# Altium project piec_aero.PrjPcb
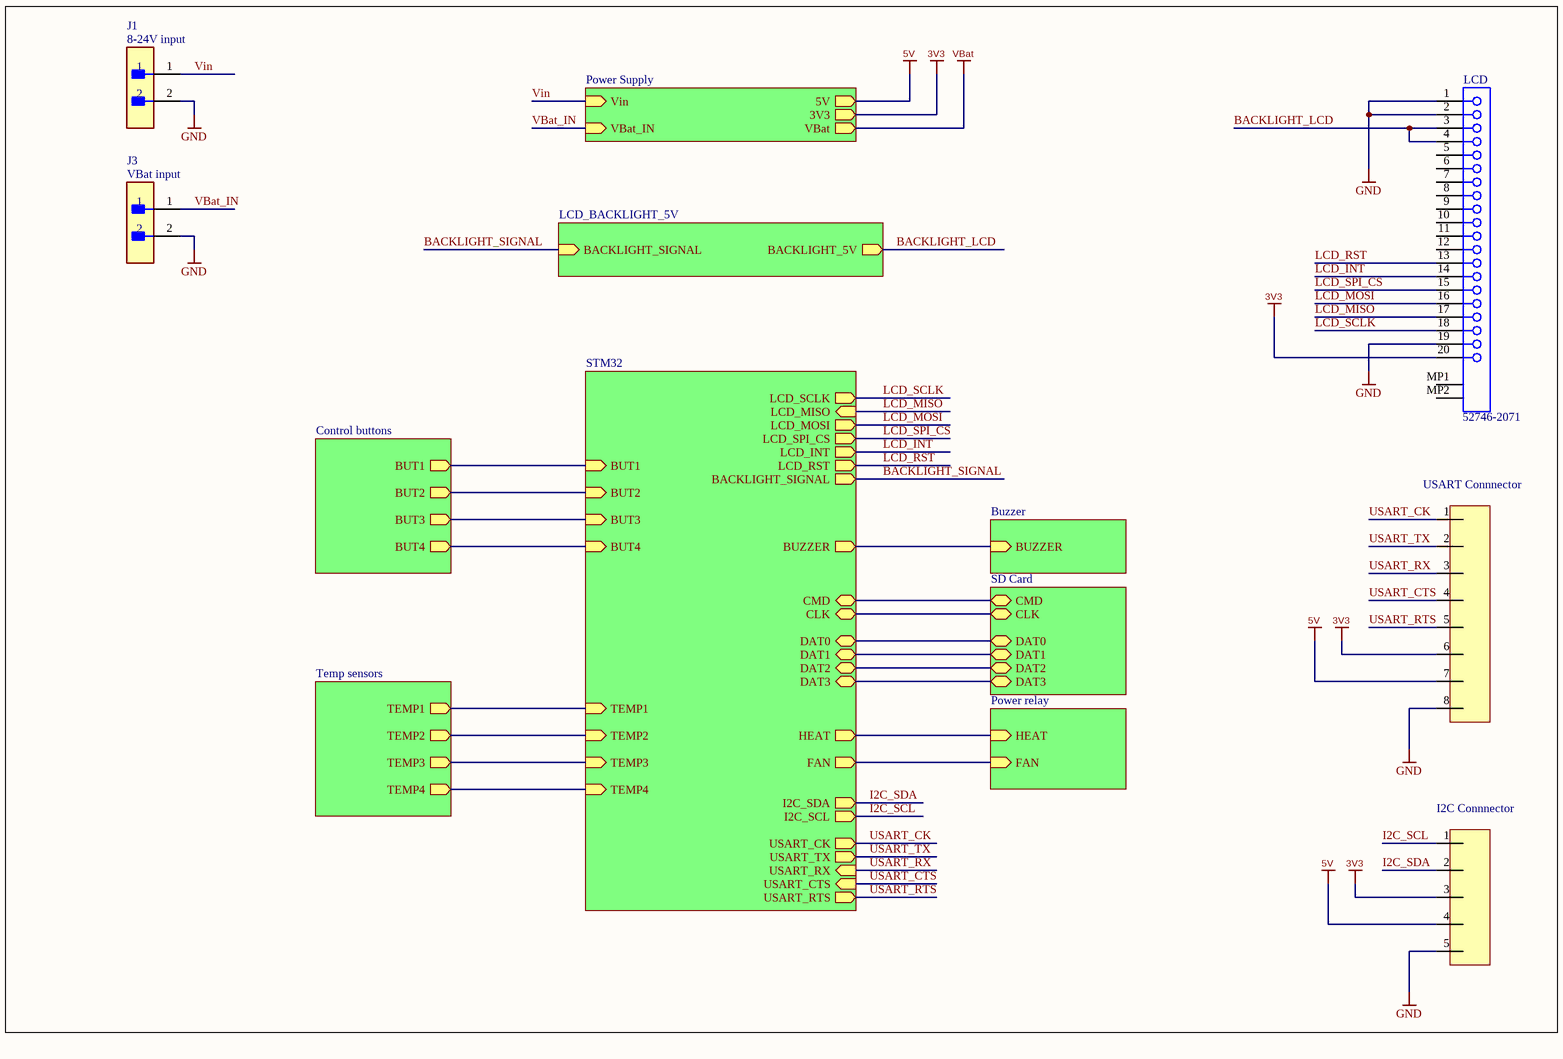
[diagram p0: MAIN_SCHEMATIC.SchDoc]
9 sheets, 164 parts. Net scope: hierarchical (ports join the sheet entries above them; power ports are global).
Board file: FURNACE.PcbDoc
Sheets:
  MAIN_SCHEMATIC.SchDoc
    STM32 = STM32.SchDoc
    Power Supply = POWER_SUPPLY.SchDoc
    Control buttons = BUTTONS.SchDoc
    Temp sensors = PT1000.SchDoc
    Power relay = SR40A.SchDoc
    SD Card = SD_CARD.SchDoc
    Buzzer = BUZZER.SchDoc
    LCD_BACKLIGHT_5V = 3V3_5V_LEVEL_SHIFTER.SchDoc

## Sheet MAIN_SCHEMATIC.SchDoc
size A4; SheetNumber: 1; SheetTotal: 9

### Parts
J1  B2B-XH-A(LF)(SN)  [FP-B2B-XH-A_LF_SN-MFG]  (value not drawn)
J2  52746-2071  [MOLX-52746-2071]
J3  B2B-XH-A(LF)(SN)  [FP-B2B-XH-A_LF_SN-MFG]  (value not drawn)
J4  NSL254M-8G  [NSL254M-8G]  (value not drawn)
J5  NSL254M-5G  [NSL254M-5G]  (value not drawn)

### Sub-sheets
Buzzer = BUZZER.SchDoc: BUZZER (in)
Control buttons = BUTTONS.SchDoc: BUT1 (out), BUT2 (out), BUT3 (out), BUT4 (out)
LCD_BACKLIGHT_5V = 3V3_5V_LEVEL_SHIFTER.SchDoc: BACKLIGHT_SIGNAL (in), BACKLIGHT_5V (out)
Power relay = SR40A.SchDoc: HEAT (in), FAN (in)
Power Supply = POWER_SUPPLY.SchDoc: Vin (in), 5V (out), 3V3 (out), VBat (out), VBat_IN (in)
SD Card = SD_CARD.SchDoc: CMD (bidir), CLK (bidir), DAT0 (bidir), DAT1 (bidir), DAT2 (bidir), DAT3 (bidir)
STM32 = STM32: BUT1 (in), BUT2 (in), BUT3 (in), BUT4 (in), TEMP1 (in), TEMP2 (in), TEMP3 (in), TEMP4 (in), HEAT (out), FAN (out), CMD (bidir), CLK (bidir), DAT0 (bidir), DAT1 (bidir), DAT2 (bidir), DAT3 (bidir), BUZZER (out), LCD_SCLK (out), LCD_MISO (in), LCD_MOSI (out), LCD_SPI_CS (out), LCD_INT (out), LCD_RST (out), BACKLIGHT_SIGNAL (out), I2C_SDA (out), I2C_SCL (out), USART_CK (out), USART_TX (out), USART_RX (in), USART_RTS (out), USART_CTS (in)
Temp sensors = PT1000.SchDoc: TEMP1 (out), TEMP2 (out), TEMP3 (out), TEMP4 (out)

### Nets
3V3: J2.20 J4.6 J5.3 ; sheet Power Supply/3V3
5V: J4.7 J5.4 ; sheet Power Supply/5V
GND: J1.2 J2.1 J2.2 J2.19 J3.2 J4.8 J5.5
VBat_IN: J3.1 ; sheet Power Supply/VBat, sheet Power Supply/VBat_IN  [also labelled VBat]
BACKLIGHT_LCD: J2.3 J2.4 ; sheet LCD_BACKLIGHT_5V/BACKLIGHT_5V
BACKLIGHT_SIGNAL: sheet STM32/BACKLIGHT_SIGNAL, sheet LCD_BACKLIGHT_5V/BACKLIGHT_SIGNAL
CLK: sheet STM32/CLK, sheet SD Card/CLK
CMD: sheet STM32/CMD, sheet SD Card/CMD
DAT0: sheet STM32/DAT0, sheet SD Card/DAT0
DAT1: sheet STM32/DAT1, sheet SD Card/DAT1
DAT2: sheet STM32/DAT2, sheet SD Card/DAT2
DAT3: sheet STM32/DAT3, sheet SD Card/DAT3
I2C_SCL: J5.1 ; sheet STM32/I2C_SCL
I2C_SDA: J5.2 ; sheet STM32/I2C_SDA
LCD_INT: J2.14 ; sheet STM32/LCD_INT
LCD_MISO: J2.17 ; sheet STM32/LCD_MISO
LCD_MOSI: J2.16 ; sheet STM32/LCD_MOSI
LCD_RST: J2.13 ; sheet STM32/LCD_RST
LCD_SCLK: J2.18 ; sheet STM32/LCD_SCLK
LCD_SPI_CS: J2.15 ; sheet STM32/LCD_SPI_CS
USART_CK: J4.1 ; sheet STM32/USART_CK
USART_CTS: J4.4 ; sheet STM32/USART_CTS
USART_RTS: J4.5 ; sheet STM32/USART_RTS
USART_RX: J4.3 ; sheet STM32/USART_RX
USART_TX: J4.2 ; sheet STM32/USART_TX
Vin: J1.1 ; sheet Power Supply/Vin
NetC31_1: sheet STM32/BUT1, sheet Control buttons/BUT1
NetC32_1: sheet STM32/BUT2, sheet Control buttons/BUT2
NetC33_1: sheet STM32/BUT3, sheet Control buttons/BUT3
NetC34_1: sheet STM32/BUT4, sheet Control buttons/BUT4
NetC36_1: sheet STM32/TEMP1, sheet Temp sensors/TEMP1
NetC38_1: sheet STM32/TEMP2, sheet Temp sensors/TEMP2
NetC40_1: sheet STM32/TEMP3, sheet Temp sensors/TEMP3
NetC42_1: sheet STM32/TEMP4, sheet Temp sensors/TEMP4
NetR58_1: sheet STM32/HEAT, sheet Power relay/HEAT
NetR61_1: sheet STM32/FAN, sheet Power relay/FAN
NetR70_1: sheet STM32/BUZZER, sheet Buzzer/BUZZER

Not connected (* = marked no-connect by the designer): J2 5 6 7 8 9 10 11 12 MP1 MP2

### Notes on the sheet
- (near J1) 8-24V input
- (near J2) LCD
- (near J3) VBat input
- (near J4) USART Connnector
- (near J5) I2C Connnector

### Library data of the parts
J1 J3 = CMP-2000-05888-3: CONN HEADER VERT 2POS 2.5MM; Current Rating: 3A; Voltage Rating: 250V; Number of Contacts: 2; Contact Resistance: 20mR; Wire/Cable Gauge: 22AWG; Insulation Resistance: 1GR; Connector Type: Male Pin; Packaging: Bulk; Contact Material: Brass; Lead Free: Lead Free; Orientation: Straight; Contact Plating: Tin; Max Current Rating: 3A; Termination: Solder; Fastening Type: Detent; Depth: 5.75mm; Housing Material: Polyamide; REACH SVHC: No SVHC; Series: XH; Voltage Rating (AC): 250V; Number of Positions: 2; Color: Natural; Contact Type: Male Pin; Max Voltage Rating (DC): 250V; Pitch: 2.5mm; Lead Pitch: 2.5mm; Mount: Through Hole; Max Operating Temperature: 85°C; Length: 7.4mm; Max Voltage Rating (AC): 250V; Min Operating Temperature: -25°C; Number of Rows: 1; Housing Color: White
J2 = CMP-1241-00382-1: 0.5 mm Pitch Easy-On(TM) Type FPC Connector, 2.0 mm Mated Height, Right Angle, ZIF, SMT, Bottom Contact, 20 Circuits, -20 to 85 degC, ELV and RoHS Compliant, Tape and Reel; Manufacturer: Molex; PCB Retention: Yes; Stackable: No; Pitch - Mating Interface: 0.50mm; Mated Height: 2.00mm; Entry Angle: 90degrees Angle; Material - Plating Mating: Gold; Current (Max per Contact): 0.5A; Durability (mating cycles max): 20; Material - Metal: Phosphor Bronze; Voltage (Max): 50V; ComponentLink1Description: Manufacturer URL; Polarized to PCB: Yes; Orientation: Right Angle; Contact Position: Bottom; ComponentLink2Description: Datasheet; PackageDescription: 20-Lead FPC Connector, Pitch 0.5 mm; Packing: Tape and Reel; PackageReference: 52746-2071; ComponentLink3Description: Package Specification; Material - Plating Termination: Gold; PackageVersion: Rev. H, 05/2009; ComponentLink2URL: http://www.molex.com/webdocs/datasheets/pdf/en-us/0527462071_FFC_FPC_CONNECTORS.pdf; Circuits (Loaded): 20; ComponentLink3URL: http://www.molex.com/pdm_docs/sd/527462071_sd.pdf; Mounting Technology: Surface Mount; PartNumber: 52746-2071; RoHS: TRUE; ComponentLink1URL: http://www.molex.com/molex/index.jsp; PCB Locator: No; Number of Rows: 1
J4 = NSL254M-8G: 7pin, 2.54mm THT connector
J5 = NSL254M-5G: 5pin, 2.54mm THT connector

## Sheet STM32.SchDoc
size A4; SheetNumber: 3; SheetTotal: 9
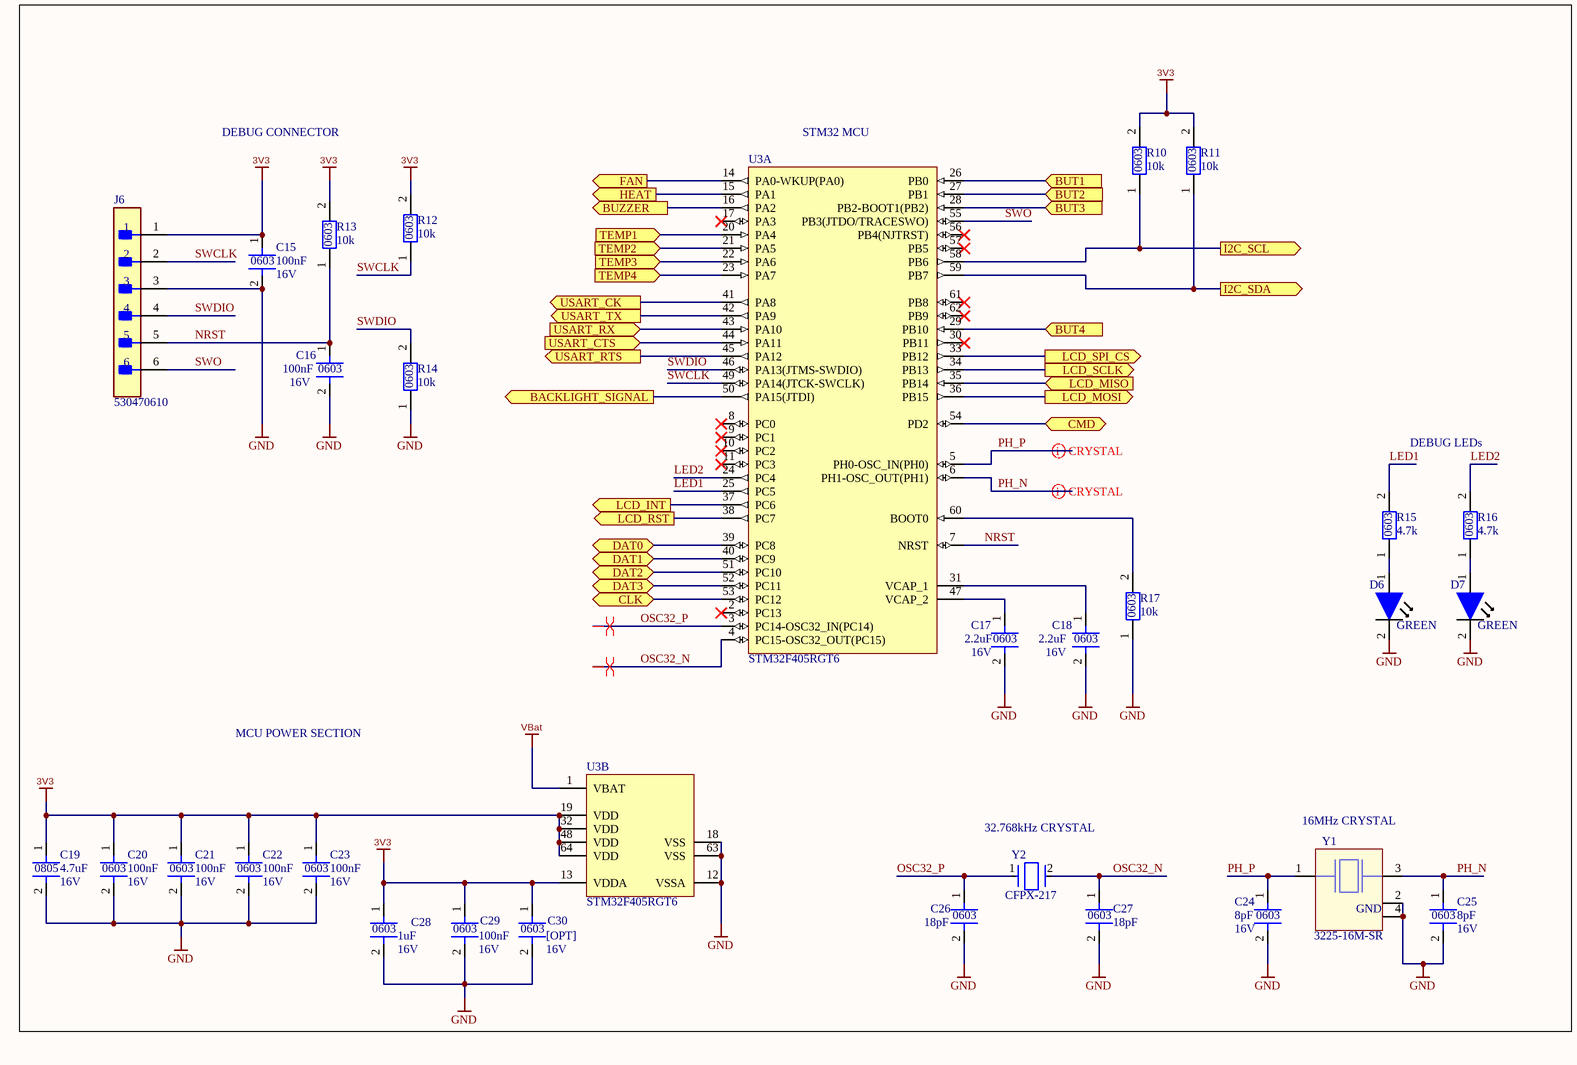
[diagram p1: STM32.SchDoc]

### Parts
C15  SMD 0603 Capacitor  [CAPACITOR_SMD_0603]  (value not drawn)
C16  SMD 0603 Capacitor  [CAPACITOR_SMD_0603]  (value not drawn)
C17  SMD 0603 Capacitor  [CAPACITOR_SMD_0603]  (value not drawn)
C18  SMD 0603 Capacitor  [CAPACITOR_SMD_0603]  (value not drawn)
C19  SMD 0805 Capacitor  [CAPACITOR_SMD_0805_IPC]  (value not drawn)
C20  SMD 0603 Capacitor  [CAPACITOR_SMD_0603]  (value not drawn)
C21  SMD 0603 Capacitor  [CAPACITOR_SMD_0603]  (value not drawn)
C22  SMD 0603 Capacitor  [CAPACITOR_SMD_0603]  (value not drawn)
C23  SMD 0603 Capacitor  [CAPACITOR_SMD_0603]  (value not drawn)
C24  SMD 0603 Capacitor  [CAPACITOR_SMD_0603]  (value not drawn)
C25  SMD 0603 Capacitor  [CAPACITOR_SMD_0603]  (value not drawn)
C26  SMD 0603 Capacitor  [CAPACITOR_SMD_0603]  (value not drawn)
C27  SMD 0603 Capacitor  [CAPACITOR_SMD_0603]  (value not drawn)
C28  SMD 0603 Capacitor  [CAPACITOR_SMD_0603]  (value not drawn)
C29  SMD 0603 Capacitor  [CAPACITOR_SMD_0603]  (value not drawn)
C30  SMD 0603 Capacitor  [CAPACITOR_SMD_0603]  (value not drawn)
D6  SMD LED 0603  [0603 LED]  (value not drawn)
D7  SMD LED 0603  [0603 LED]  (value not drawn)
J6  530470610  [FP-530470610-MFG]
R10  SMD 0603 Resistor  [RESISTOR_SMD_0603]  (value not drawn)
R11  SMD 0603 Resistor  [RESISTOR_SMD_0603]  (value not drawn)
R12  SMD 0603 Resistor  [RESISTOR_SMD_0603]  (value not drawn)
R13  SMD 0603 Resistor  [RESISTOR_SMD_0603]  (value not drawn)
R14  SMD 0603 Resistor  [RESISTOR_SMD_0603]  (value not drawn)
R15  SMD 0603 Resistor  [RESISTOR_SMD_0603]  (value not drawn)
R16  SMD 0603 Resistor  [RESISTOR_SMD_0603]  (value not drawn)
R17  SMD 0603 Resistor  [RESISTOR_SMD_0603]  (value not drawn)
U3  STM32F405RGT6  [STM-LQFP64_V]  (parts A,B of 2)
Y1  3225-16M-SR  [3225-16M-SR]
Y2  CFPX-217  [FP-ABS07-MFG]

### Ports
BACKLIGHT_SIGNAL (out, see MAIN_SCHEMATIC[3B], 3V3_5V_LEVEL_SHIFTER[1B]), BUT1 (in, see MAIN_SCHEMATIC[2B], BUTTONS[3A]), BUT2 (in, see MAIN_SCHEMATIC[2B], BUTTONS[3B]), BUT3 (in, see MAIN_SCHEMATIC[2C], BUTTONS[3C]), BUT4 (in, see MAIN_SCHEMATIC[2C], BUTTONS[3D]), BUZZER (out, see MAIN_SCHEMATIC[3C], BUZZER[2C]), CLK (bidir, see MAIN_SCHEMATIC[3C], SD_CARD[2C]), CMD (bidir, see MAIN_SCHEMATIC[3C], SD_CARD[2C]), DAT0 (bidir, see MAIN_SCHEMATIC[3C], SD_CARD[2C]), DAT1 (bidir, see MAIN_SCHEMATIC[3C], SD_CARD[2C]), DAT2 (bidir, see MAIN_SCHEMATIC[3C], SD_CARD[2B]), DAT3 (bidir, see MAIN_SCHEMATIC[3C], SD_CARD[2B]), FAN (out, see MAIN_SCHEMATIC[3C], SR40A[1D]), HEAT (out, see MAIN_SCHEMATIC[3C], SR40A[1B]), I2C_SCL (out, see MAIN_SCHEMATIC[3D]), I2C_SDA (out, see MAIN_SCHEMATIC[3D]), LCD_INT (out, see MAIN_SCHEMATIC[3B]), LCD_MISO (in, see MAIN_SCHEMATIC[3B]), LCD_MOSI (out, see MAIN_SCHEMATIC[3B]), LCD_RST (out, see MAIN_SCHEMATIC[3B]), LCD_SCLK (out, see MAIN_SCHEMATIC[3B]), LCD_SPI_CS (out, see MAIN_SCHEMATIC[3B]), TEMP1 (in, see MAIN_SCHEMATIC[2C], PT1000[6A]), TEMP2 (in, see MAIN_SCHEMATIC[2C], PT1000[6B]), TEMP3 (in, see MAIN_SCHEMATIC[2C], PT1000[6C]), TEMP4 (in, see MAIN_SCHEMATIC[2D], PT1000[6D]), USART_CK (out, see MAIN_SCHEMATIC[3D]), USART_CTS (in, see MAIN_SCHEMATIC[3D]), USART_RTS (out, see MAIN_SCHEMATIC[3D]), USART_RX (in, see MAIN_SCHEMATIC[3D]), USART_TX (out, see MAIN_SCHEMATIC[3D])

### Nets
3V3: C15.1 C19.1 C20.1 C21.1 C22.1 C23.1 C28.1 C29.1 C30.1 J6.1 R10.2 R11.2 R12.2 R13.2 U3.13(VDDA) U3.19(VDD) U3.32(VDD) U3.48(VDD) U3.64(VDD)
GND: C15.2 C16.2 C17.2 C18.2 C19.2 C20.2 C21.2 C22.2 C23.2 C24.2 C25.2 C26.2 C27.2 C28.2 C29.2 C30.2 D6.2 D7.2 J6.3 R14.1 R17.1 U3.12(VSSA) U3.18(VSS) U3.63(VSS) Y1.2 Y1.4
VBat: U3.1(VBAT)  [project net VBat_IN]
BACKLIGHT_SIGNAL: U3.50(PA15(JTDI)) ; port BACKLIGHT_SIGNAL
CLK: U3.53(PC12) ; port CLK
CMD: U3.54(PD2) ; port CMD
DAT0: U3.39(PC8) ; port DAT0
DAT1: U3.40(PC9) ; port DAT1
DAT2: U3.51(PC10) ; port DAT2
DAT3: U3.52(PC11) ; port DAT3
I2C_SCL: R10.1 U3.58(PB6) ; port I2C_SCL
I2C_SDA: R11.1 U3.59(PB7) ; port I2C_SDA
LCD_INT: U3.37(PC6) ; port LCD_INT
LCD_MISO: U3.35(PB14) ; port LCD_MISO
LCD_MOSI: U3.36(PB15) ; port LCD_MOSI
LCD_RST: U3.38(PC7) ; port LCD_RST
LCD_SCLK: U3.34(PB13) ; port LCD_SCLK
LCD_SPI_CS: U3.33(PB12) ; port LCD_SPI_CS
LED1: R15.2 U3.25(PC5)
LED2: R16.2 U3.24(PC4)
NRST: C16.1 J6.5 R13.1 U3.7(NRST)
OSC32_N: C27.1 U3.4(PC15-OSC32_OUT(PC15)) Y2.2
OSC32_P: C26.1 U3.3(PC14-OSC32_IN(PC14)) Y2.1
PH_N: C25.1 U3.6(PH1-OSC_OUT(PH1)) Y1.3
PH_P: C24.1 U3.5(PH0-OSC_IN(PH0)) Y1.1
SWCLK: J6.2 R12.1 U3.49(PA14(JTCK-SWCLK))
SWDIO: J6.4 R14.2 U3.46(PA13(JTMS-SWDIO))
SWO: J6.6 U3.55(PB3(JTDO/TRACESWO))
USART_CK: U3.41(PA8) ; port USART_CK
USART_CTS: U3.44(PA11) ; port USART_CTS
USART_RTS: U3.45(PA12) ; port USART_RTS
USART_RX: U3.43(PA10) ; port USART_RX
USART_TX: U3.42(PA9) ; port USART_TX
NetC17_1: C17.1 U3.47(VCAP_2)
NetC18_1: C18.1 U3.31(VCAP_1)
NetC31_1: U3.26(PB0) ; port BUT1
NetC32_1: U3.27(PB1) ; port BUT2
NetC33_1: U3.28(PB2-BOOT1(PB2)) ; port BUT3
NetC34_1: U3.29(PB10) ; port BUT4
NetC36_1: U3.20(PA4) ; port TEMP1
NetC38_1: U3.21(PA5) ; port TEMP2
NetC40_1: U3.22(PA6) ; port TEMP3
NetC42_1: U3.23(PA7) ; port TEMP4
NetD6_1: D6.1 R15.1
NetD7_1: D7.1 R16.1
NetR17_2: R17.2 U3.60(BOOT0)
NetR58_1: U3.15(PA1) ; port HEAT
NetR61_1: U3.14(PA0-WKUP(PA0)) ; port FAN
NetR70_1: U3.16(PA2) ; port BUZZER

Not connected (* = marked no-connect by the designer): U3 2(PC13)* 8(PC0)* 9(PC1)* 10(PC2)* 11(PC3)* 17(PA3)* 30(PB11)* 56(PB4(NJTRST))* 57(PB5)* 61(PB8)* 62(PB9)*

### Layout directives
differential pair: OSC32_N, OSC32_P, PH_N, PH_P

### Notes on the sheet
- DEBUG CONNECTOR
- (near U3) STM32 MCU
- (near R10) 10k
- (near R11) 10k
- (near R13) 10k
- (near R12) 10k
- (near C15) 100nF
- (near C15) 16V
- (near C16) 100nF
- (near C16) 16V
- (near R14) 10k
- DEBUG LEDs
- (near R15) 4.7k
- (near R16) 4.7k
- (near C17) 2.2uF
- (near C17) 16V
- (near C18) 2.2uF
- (near C18) 16V
- (near R17) 10k
- (near D6) GREEN
- (near D7) GREEN
- MCU POWER SECTION
- (near Y2) 32.768kHz CRYSTAL
- (near Y1) 16MHz CRYSTAL
- 4.7uF
- (near C19) 16V
- 100nF
- (near C20) 16V
- (near C21) 16V
- (near C22) 16V
- (near C23) 100nF
- (near C23) 16V
- (near C26) 18pF
- (near C27) 18pF
- (near C24) 8pF
- (near C25) 8pF
- (near C28) 16V
- (near C28) 1uF
- (near C29) 16V
- (near C30) [OPT]
- (near C30) 16V
- (near C24) 16V
- (near C25) 16V
- (in symbol Crystal) GND
- (in symbol SMD 0603 Capacitor) 0603
- (in symbol SMD 0603 Resistor) 0603
- (in symbol SMD 0805 Capacitor) 0805

### Library data of the parts
C15-C18 C20-C30 = SMD 0603 Capacitor: 0603 capacitor
D6 D7 = SMD LED 0603: 0603 LED
J6 = CMP-2000-05476-3: CONN HEADER VERT 6POS 1.25MM; Manufacturer: Molex; Conn Gender: Male; Voltage Rating: 125V; Number Of Contacts: 6; Current Rating: 1A; Conn Orientation: Vertical; Number Of Rows: 1; Package: 0; Height: 4.4mm; Device Class L2: Headers and Wire Housings; RoHS: TRUE; Pitch: 1.25mm; Category: Conn; Device Class L1: Connectors; ComponentLink2URL: https://www.molex.com/webdocs/datasheets/pdf/en-us/0530470610_PCB_HEADERS.pdf; Temperature Range Low: -40°C; Temperature: -40°C to +85°C; Lead Free: Yes; Footprint Url: https://www.molex.com/pdm_docs/sd/530470610_sd.pdf; Temperature Range High: +85°C; Device Class L3: unset; Digikey Description: CONN HEADER VERT 6POS 1.25MM; Automotive: No; Mouser Description: Headers & Wire Housings VERTICAL HDR 6P; ComponentLink2Description: Datasheet; Contact Material: Tin; Manufacturer Part Number: 530470610; Octopart: https://octopart.com/53047-0610-molex-276776
R10-R17 = SMD 0603 Resistor: 0603 resistor
U3 = CMP-0243-00019-3: ARM Cortex-M4 32-bit MCU+FPU, 210 DMIPS, 1024 kB Flash, 192 kB Internal RAM, 51 I/Os, 64-pin LQFP, -40 to 85 degC, Tray; Manufacturer: STMicroelectronics; Supply Voltage(Vcc) min (V): 1.8; Supply Voltage(Vcc) max (V): 3.6; Internal RAM Size (kB): 192; I/Os (High Current): 51; D/A Converter: 2x12-bit; FLASH Size (Prog) (kB): 1024; Operating Frequency(F) (Processor speed) (MHz): 168; ComponentLink2Description: Datasheet; PackageVersion: Rev. 4, 06/2013; DatasheetVersion: Rev. 4; Core: ARM Cortex-M4; ComponentLink2URL: http://www.st.com/st-web-ui/static/active/en/resource/technical/document/datasheet/DM00037051.pdf; PackageReference: LQFP64; Packing: Tray; ComponentLink1Description: Manufacturer URL; ComponentLink3URL: http://www.st.com/st-web-ui/static/active/en/resource/technical/document/datasheet/DM00037051.pdf; ComponentLink3Description: Package Specification; Mounting Technology: Surface Mount; ComponentLink1URL: http://www.st.com/web/en/home.html; PackageDescription: 64-Pin Low Profile Quad Flat Package, 10 x 10 mm Body, 0.5 mm Pitch; PartNumber: STM32F405RGT6
Y1 = Crystal: SMD 16MHz crystal
Y2 = Crystal 32.768kHz: Crystal 32.768kHz 3.2mm x 1.5mm; ESR (Equivalent Series Resistance): 50kR; Load Capacitance: 6pF; Frequency Tolerance: 20ppm; Frequency: 32.768kHz; RoHS Compliant: Yes; Case/Package: SMD/SMT; Max Operating Temperature: 85°C; Series: ABS07-LR; Min Operating Temperature: -40°C; Packaging: Cut Tape; Height: 0.035inch; Width: 0.061inch; Length: 0.126inch; Mount: Surface Mount

## Sheet POWER_SUPPLY.SchDoc
size A3; SheetNumber: 2; SheetTotal: 9
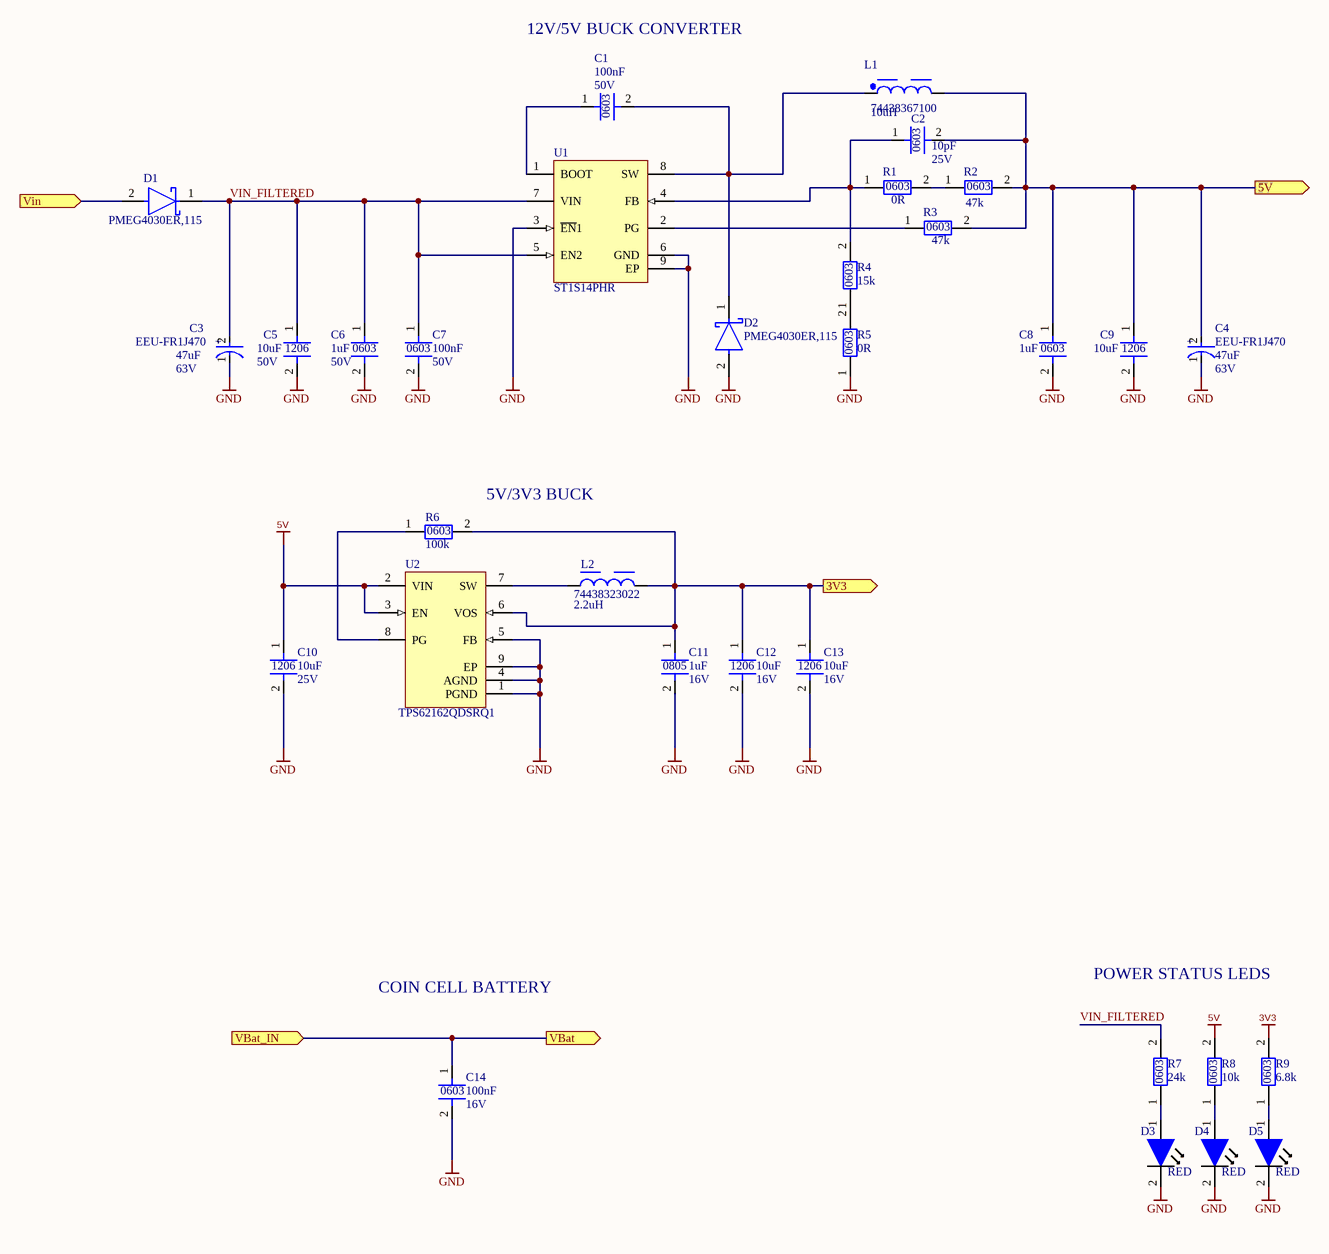
[diagram p2: POWER_SUPPLY.SchDoc]

### Parts
C1  SMD 0603 Capacitor  [CAPACITOR_SMD_0603]  (value not drawn)
C2  SMD 0603 Capacitor  [CAPACITOR_SMD_0603]  (value not drawn)
C3  EEU-FR1J470  [FP-EEU-FR1J470-MFG]
C4  EEU-FR1J470  [FP-EEU-FR1J470-MFG]
C5  SMD 1206 Capacitor  [CAPACITOR_SMD_1206]  (value not drawn)
C6  SMD 0603 Capacitor  [CAPACITOR_SMD_0603]  (value not drawn)
C7  SMD 0603 Capacitor  [CAPACITOR_SMD_0603]  (value not drawn)
C8  SMD 0603 Capacitor  [CAPACITOR_SMD_0603]  (value not drawn)
C9  SMD 1206 Capacitor  [CAPACITOR_SMD_1206]  (value not drawn)
C10  SMD 1206 Capacitor  [CAPACITOR_SMD_1206]  (value not drawn)
C11  SMD 0805 Capacitor  [CAPACITOR_SMD_0805_IPC]  (value not drawn)
C12  SMD 1206 Capacitor  [CAPACITOR_SMD_1206]  (value not drawn)
C13  SMD 1206 Capacitor  [CAPACITOR_SMD_1206]  (value not drawn)
C14  SMD 0603 Capacitor  [CAPACITOR_SMD_0603]  (value not drawn)
D1  PMEG4030ER,115  [FP-SOD123W-MFG]
D2  PMEG4030ER,115  [FP-SOD123W-MFG]
D3  SMD LED 0603  [0603 LED]  (value not drawn)
D4  SMD LED 0603  [0603 LED]  (value not drawn)
D5  SMD LED 0603  [0603 LED]  (value not drawn)
L1  74438367100  [WE-MAPI_5030]
L2  74438323022  [WE-MAPI_2510]
R1  SMD 0603 Resistor  [RESISTOR_SMD_0603]  (value not drawn)
R2  SMD 0603 Resistor  [RESISTOR_SMD_0603]  (value not drawn)
R3  SMD 0603 Resistor  [RESISTOR_SMD_0603]  (value not drawn)
R4  SMD 0603 Resistor  [RESISTOR_SMD_0603]  (value not drawn)
R5  SMD 0603 Resistor  [RESISTOR_SMD_0603]  (value not drawn)
R6  SMD 0603 Resistor  [RESISTOR_SMD_0603]  (value not drawn)
R7  SMD 0603 Resistor  [RESISTOR_SMD_0603]  (value not drawn)
R8  SMD 0603 Resistor  [RESISTOR_SMD_0603]  (value not drawn)
R9  SMD 0603 Resistor  [RESISTOR_SMD_0603]  (value not drawn)
U1  ST1S14PHR  [HSO-8_L]
U2  TPS62162QDSRQ1  [DSG0008A_V]

### Ports
3V3 (out, see MAIN_SCHEMATIC[3A]), 5V (out, see MAIN_SCHEMATIC[3A]), VBat (out, see MAIN_SCHEMATIC[3A]), VBat_IN (in, see MAIN_SCHEMATIC[2A]), Vin (in, see MAIN_SCHEMATIC[2A])

### Nets
3V3: C11.1 C12.1 C13.1 L2.2 R6.2 R9.2 U2.6(VOS) ; port 3V3
5V: C2.2 C4.2(A) C8.1 C9.1 C10.1 L1.2 R2.2 R3.2 R8.2 U2.2(VIN) U2.3(EN) ; port 5V
GND: C3.1(C) C4.1(C) C5.2 C6.2 C7.2 C8.2 C9.2 C10.2 C11.2 C12.2 C13.2 C14.2 D2.2(A) D3.2 D4.2 D5.2 R5.1 U1.3(~{EN}1) U1.6(GND) U1.9(EP) U2.1(PGND) U2.4(AGND) U2.5(FB) U2.9(EP)
VBat_IN: C14.1 ; port VBat, port VBat_IN
Vin: D1.2(A) ; port Vin
VIN_FILTERED: C3.2(A) C5.1 C6.1 C7.1 D1.1(C) R7.2 U1.5(EN2) U1.7(VIN)
NetC1_1: C1.1 U1.1(BOOT)
NetC1_2: C1.2 D2.1(C) L1.1 U1.8(SW)
NetC2_1: C2.1 R1.1 R4.2 U1.4(FB)
NetD3_1: D3.1 R7.1
NetD4_1: D4.1 R8.1
NetD5_1: D5.1 R9.1
NetL2_1: L2.1 U2.7(SW)
NetR1_2: R1.2 R2.1
NetR3_1: R3.1 U1.2(PG)
NetR4_1: R4.1 R5.2
NetR6_1: R6.1 U2.8(PG)

### Notes on the sheet
- 12V/5V BUCK CONVERTER
- (near C1) 100nF
- (near C1) 50V
- 10uH
- (near C2) 10pF
- (near C2) 25V
- (near R2) 47k
- (near R1) 0R
- (near R3) 47k
- (near R4) 15k
- (near C3) 47uF
- (near C3) 63V
- 10uF
- 50V
- (near C6) 1uF
- (near C6) 50V
- (near C7) 100nF
- (near C7) 50V
- (near R5) 0R
- (near C8) 1uF
- (near C9) 10uF
- (near C4) 47uF
- (near C4) 63V
- (near R6) 5V/3V3 BUCK
- (near R6) 100k
- (near L2) 2.2uH
- (near C10) 10uF
- (near C10) 25V
- (near C11) 1uF
- (near C11) 16V
- (near C12) 10uF
- (near C12) 16V
- (near C13) 10uF
- (near C13) 16V
- COIN CELL BATTERY
- POWER STATUS LEDS
- (near C14) 100nF
- (near C14) 16V
- (near R7) 24k
- (near R8) 10k
- (near R9) 6.8k
- (near D3) RED
- (near D4) RED
- (near D5) RED
- (in symbol CMP-05427-000066-1) +
- (in symbol SMD 0603 Capacitor) 0603
- (in symbol SMD 0603 Resistor) 0603
- (in symbol SMD 0805 Capacitor) 0805
- (in symbol SMD 1206 Capacitor) 1206

### Library data of the parts
C1 C2 C6-C8 C14 = SMD 0603 Capacitor: 0603 capacitor
C3 C4 = CMP-05427-000066-1: CAP ALUM 47UF 20% 63V RADIAL; ESR (Equivalent Series Resistance): 210mR; Lead Diameter: 0.5mm; Life (Hours): 5000Hour; Ripple Current (AC): 284mA; Height - Seated (Max): 0.5inch; Radiation Hardening: No; Termination: Radial; Contact Plating: Tin; Length: 11.2mm; Tolerance: 20%; Voltage: 63V; Max Operating Temperature: 105°C; Construction: Cylindrical; Lead Free: Lead Free; Series: FR; Mount: Through Hole; Lead Pitch: 2.5mm; Capacitance: 47uF; Case/Package: Radial; Voltage Rating (DC): 63V; Diameter: 6.3mm; Impedance: 210mR; RoHS Compliant: Yes; Height: 11.2mm; REACH SVHC: No SVHC; Package Quantity: 200; Ripple Current: 284mA; Voltage Rating: 63V; Packaging: Bulk; Min Operating Temperature: -40°C
C5 C9 C10 C12 C13 = SMD 1206 Capacitor: 1206 capacitor
D1 D2 = CMP-14398-000026-1: DIODE SCHOTTKY 40V 3A SOD123W; RoHS Compliant: Yes
D3-D5 = SMD LED 0603: 0603 LED
L1 = CMP-03913-130924348-3: Power Inductor, 10Uh, Shielded, 4.8A Rohs Compliant: Yes; DC Resistance (DCR): 61mΩ; Current Rating: 3.3A; Inductance: 10µH; Min Operating Temperature: -40°C; Ambient Temperature Range High: 85°C; Max Operating Temperature: 125°C; Width: 5.4mm; Length: 5.4mm; RoHS: Compliant; Height: 3.1mm; Ambient Temperature Range Low: -40°C
L2 = CMP-1411-00006-4: Inductor Power Shielded Wirewound 2.2uH 20% 100KHz Powdered Iron 1.3A 176mOhm DCR 1008 T/R; Saturation Current: 2.5A; Series Resistance: 147mΩ; Self Resonant Frequency: 60MHz; Core Material: Composite, Ferrite, Metal; Inductance: 2.2µH; Height - Seated (Max): 990.6µm; Tolerance: 20%; Case Code (Metric): 2520; Min Operating Temperature: -40°C; Termination: SMD/SMT; DC Resistance (DCR): 147mΩ; RMS Current (Irms): 1.3A; Width: 2mm; Height: 1mm; RoHS: Compliant; Ambient Temperature Range Low: -40°C; Mount: Surface Mount; Test Frequency: 100kHz; Max Operating Temperature: 125°C; Depth: 2mm; Case Code (Imperial): 1008; Shielding: Shielded; Max DC Current: 1.3A; Case/Package: SMD/SMT; Ambient Temperature Range High: 85°C; Inductance Tolerance: 20%; REACH SVHC: Unknown; Weight: 32.006612mg; Current Rating: 1.3A; Number of Pins: 2; Length: 2.5mm
R1-R9 = SMD 0603 Resistor: 0603 resistor
U1 = CMP-0240-00043-1: Up to 3 A step down switching regulator, 8-Pin HSOP; ComponentLink1Description: Manufacturer URL; PackageVersion: 2007; ComponentLink2URL: http://www.st.com/internet/com/TECHNICAL_RESOURCES/TECHNICAL_LITERATURE/DATASHEET/CD00285678.pdf; DatasheetVersion: Oct-2010; ComponentLink2Description: Datasheet; PackageReference: HSO-8; PackageDescription: 8-Pin Small Outline Integrated Circuit 1.27 mm Pitch; ComponentLink1URL: http://www.st.com
U2 = CMP-0323-00319-3: Buck Step Down Regulator with 3 to 17 V Input and 3.3 V Output, -40 to 85 degC, 8-Pin WSON (DSG), Green (RoHS & no Sb/Br); Manufacturer: Texas Instruments; PartNumber: TPS62162DSGT; Synchronous Rectification: TRUE; Iq(Typ)(mA): 0.017; Switch Current Limit(Typ)(A): 1.8; Regulated Outputs(#): 1; Duty Cycle(Max)(%): 100; SubFamily: Step-Down Regulator; Preset Vout(V): 3.3; Rating: Catalog; Vin(Max)(V): 17; Vin(Min)(V): 3; ComponentLink2Description: Package Specification; PackageVersion: revB, Oct-2010; DatasheetVersion: SLVSAM2A; ComponentLink1Description: Datasheet; PackageDescription: 8-Pin Plastic Small Outline No-Lead, 2 x 2 x 0.8 mm Body, 0.5 mm Pitch, Exposed Pad; ComponentLink2URL: http://www.ti.com/litv/pdf/mpds308a; Code_JEDEC: MO-229; ComponentLink3URL: Samples URL:http://www.ti.com/product/tps54611#samples; Mounting Technology: Surface Mount; Eco-Plan: Green (RoHS & no Sb/Br); Vout(Min)(V): 3.3; PackageReference: DSG0008A; Topology: Buck; ComponentLink1URL: http://www.ti.com/general/docs/lit/getliterature.tsp?genericPartNumber=TPS62162&fileType=pdf; Vout(Max)(V): 3.3; Iout(Max)(A): 1; ComponentLink3Description: URL Link1
C11 = SMD 0805 Capacitor: Capacitance: *

## Sheet BUTTONS.SchDoc
size A4; SheetNumber: 4; SheetTotal: 9
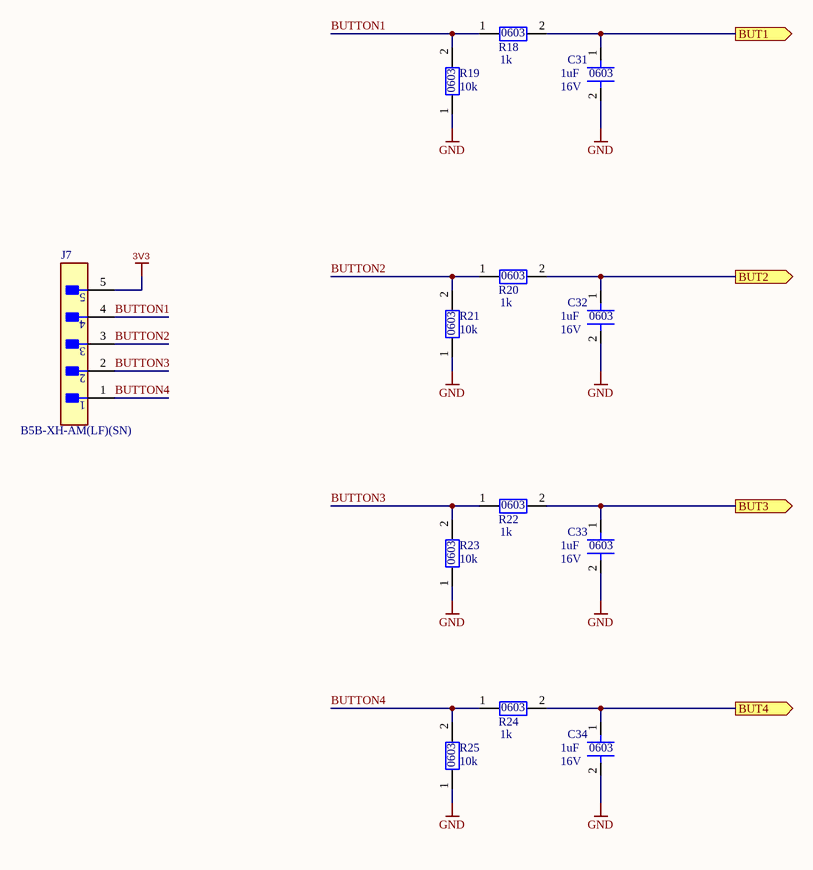
[diagram p3: BUTTONS.SchDoc]

### Parts
C31  SMD 0603 Capacitor  [CAPACITOR_SMD_0603]  (value not drawn)
C32  SMD 0603 Capacitor  [CAPACITOR_SMD_0603]  (value not drawn)
C33  SMD 0603 Capacitor  [CAPACITOR_SMD_0603]  (value not drawn)
C34  SMD 0603 Capacitor  [CAPACITOR_SMD_0603]  (value not drawn)
J7  B5B-XH-AM(LF)(SN)  [FP-B5B-XH-AM_LF_SN-MFG]
R18  SMD 0603 Resistor  [RESISTOR_SMD_0603]  (value not drawn)
R19  SMD 0603 Resistor  [RESISTOR_SMD_0603]  (value not drawn)
R20  SMD 0603 Resistor  [RESISTOR_SMD_0603]  (value not drawn)
R21  SMD 0603 Resistor  [RESISTOR_SMD_0603]  (value not drawn)
R22  SMD 0603 Resistor  [RESISTOR_SMD_0603]  (value not drawn)
R23  SMD 0603 Resistor  [RESISTOR_SMD_0603]  (value not drawn)
R24  SMD 0603 Resistor  [RESISTOR_SMD_0603]  (value not drawn)
R25  SMD 0603 Resistor  [RESISTOR_SMD_0603]  (value not drawn)

### Ports
BUT1 (out, see MAIN_SCHEMATIC[2B], STM32[3A]), BUT2 (out, see MAIN_SCHEMATIC[2B], STM32[3A]), BUT3 (out, see MAIN_SCHEMATIC[2C], STM32[3A]), BUT4 (out, see MAIN_SCHEMATIC[2C], STM32[3B])

### Nets
3V3: J7.5
GND: C31.2 C32.2 C33.2 C34.2 R19.1 R21.1 R23.1 R25.1
BUTTON1: J7.4 R18.1 R19.2
BUTTON2: J7.3 R20.1 R21.2
BUTTON3: J7.2 R22.1 R23.2
BUTTON4: J7.1 R24.1 R25.2
NetC31_1: C31.1 R18.2 ; port BUT1
NetC32_1: C32.1 R20.2 ; port BUT2
NetC33_1: C33.1 R22.2 ; port BUT3
NetC34_1: C34.1 R24.2 ; port BUT4

### Notes on the sheet
- (near R19) 10k
- (near R18) 1k
- (near C31) 1uF
- (near C31) 16V
- (near R21) 10k
- (near R20) 1k
- (near C32) 1uF
- (near C32) 16V
- (near R23) 10k
- (near R22) 1k
- (near C33) 1uF
- (near C33) 16V
- (near R25) 10k
- (near R24) 1k
- (near C34) 1uF
- (near C34) 16V
- (in symbol SMD 0603 Capacitor) 0603
- (in symbol SMD 0603 Resistor) 0603

### Library data of the parts
C31-C34 = SMD 0603 Capacitor: 0603 capacitor
J7 = CMP-17439-000304-1: CONN HEADER VERT 5POS 2.5MM; Mated Stacking Heights: 9.8mm; Voltage Rating: 250V; Max Current Rating: 3A; Number of Positions: 5; Contact Resistance: 20mR; Depth: 5.75mm; Connector Type: Header; Color: Green; Insulation Material: Nylon; Contact Plating: Copper; Length: 14.9mm; Fastening Type: Detent; Contact Material: Brass; Number of Rows: 1; Contact Type: Male Pin; Housing Material: Polyamide; Housing Color: White; Lead Free: Lead Free; Max Voltage Rating (AC): 250V; Mount: Through Hole; Contact Shape: Square; Min Operating Temperature: -25°C; Packaging: Bulk; Orientation: Straight; Insulation Color: Natural; Series: XH; Flammability Rating: UL94 V-0; Contact Finish - Mating: TIN; Max Operating Temperature: 85°C; Termination: Solder; Pitch: 2.5mm
R18-R25 = SMD 0603 Resistor: 0603 resistor

## Sheet PT1000.SchDoc
size A3; SheetNumber: 5; SheetTotal: 9
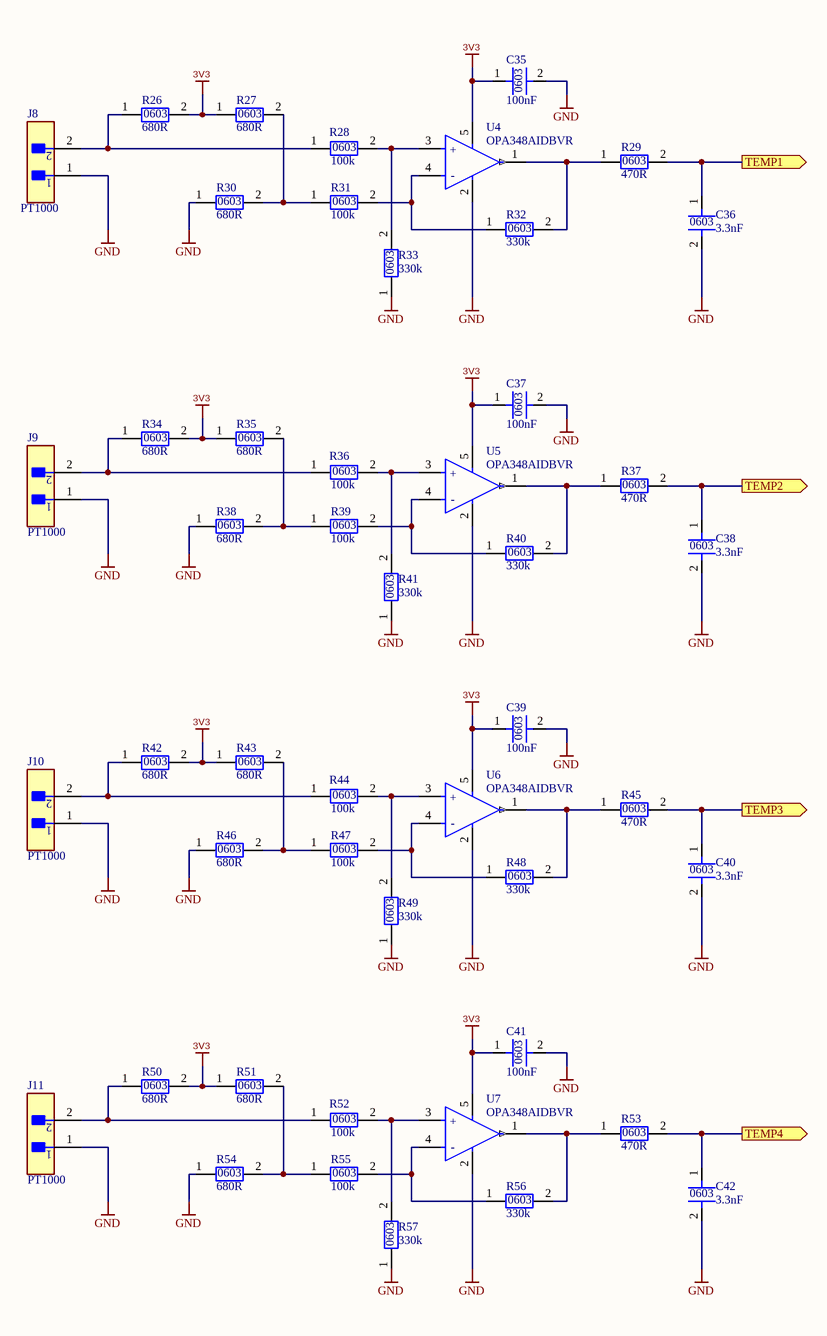
[diagram p4: PT1000.SchDoc]

### Parts
C35  SMD 0603 Capacitor  [CAPACITOR_SMD_0603]  (value not drawn)
C36  SMD 0603 Capacitor  [CAPACITOR_SMD_0603]  (value not drawn)
C37  SMD 0603 Capacitor  [CAPACITOR_SMD_0603]  (value not drawn)
C38  SMD 0603 Capacitor  [CAPACITOR_SMD_0603]  (value not drawn)
C39  SMD 0603 Capacitor  [CAPACITOR_SMD_0603]  (value not drawn)
C40  SMD 0603 Capacitor  [CAPACITOR_SMD_0603]  (value not drawn)
C41  SMD 0603 Capacitor  [CAPACITOR_SMD_0603]  (value not drawn)
C42  SMD 0603 Capacitor  [CAPACITOR_SMD_0603]  (value not drawn)
J8  B2B-XH-A(LF)(SN)  [FP-B2B-XH-A_LF_SN-MFG]  (value not drawn)
J9  B2B-XH-A(LF)(SN)  [FP-B2B-XH-A_LF_SN-MFG]  (value not drawn)
J10  B2B-XH-A(LF)(SN)  [FP-B2B-XH-A_LF_SN-MFG]  (value not drawn)
J11  B2B-XH-A(LF)(SN)  [FP-B2B-XH-A_LF_SN-MFG]  (value not drawn)
R26  SMD 0603 Resistor  [RESISTOR_SMD_0603]  (value not drawn)
R27  SMD 0603 Resistor  [RESISTOR_SMD_0603]  (value not drawn)
R28  SMD 0603 Resistor  [RESISTOR_SMD_0603]  (value not drawn)
R29  SMD 0603 Resistor  [RESISTOR_SMD_0603]  (value not drawn)
R30  SMD 0603 Resistor  [RESISTOR_SMD_0603]  (value not drawn)
R31  SMD 0603 Resistor  [RESISTOR_SMD_0603]  (value not drawn)
R32  SMD 0603 Resistor  [RESISTOR_SMD_0603]  (value not drawn)
R33  SMD 0603 Resistor  [RESISTOR_SMD_0603]  (value not drawn)
R34  SMD 0603 Resistor  [RESISTOR_SMD_0603]  (value not drawn)
R35  SMD 0603 Resistor  [RESISTOR_SMD_0603]  (value not drawn)
R36  SMD 0603 Resistor  [RESISTOR_SMD_0603]  (value not drawn)
R37  SMD 0603 Resistor  [RESISTOR_SMD_0603]  (value not drawn)
R38  SMD 0603 Resistor  [RESISTOR_SMD_0603]  (value not drawn)
R39  SMD 0603 Resistor  [RESISTOR_SMD_0603]  (value not drawn)
R40  SMD 0603 Resistor  [RESISTOR_SMD_0603]  (value not drawn)
R41  SMD 0603 Resistor  [RESISTOR_SMD_0603]  (value not drawn)
R42  SMD 0603 Resistor  [RESISTOR_SMD_0603]  (value not drawn)
R43  SMD 0603 Resistor  [RESISTOR_SMD_0603]  (value not drawn)
R44  SMD 0603 Resistor  [RESISTOR_SMD_0603]  (value not drawn)
R45  SMD 0603 Resistor  [RESISTOR_SMD_0603]  (value not drawn)
R46  SMD 0603 Resistor  [RESISTOR_SMD_0603]  (value not drawn)
R47  SMD 0603 Resistor  [RESISTOR_SMD_0603]  (value not drawn)
R48  SMD 0603 Resistor  [RESISTOR_SMD_0603]  (value not drawn)
R49  SMD 0603 Resistor  [RESISTOR_SMD_0603]  (value not drawn)
R50  SMD 0603 Resistor  [RESISTOR_SMD_0603]  (value not drawn)
R51  SMD 0603 Resistor  [RESISTOR_SMD_0603]  (value not drawn)
R52  SMD 0603 Resistor  [RESISTOR_SMD_0603]  (value not drawn)
R53  SMD 0603 Resistor  [RESISTOR_SMD_0603]  (value not drawn)
R54  SMD 0603 Resistor  [RESISTOR_SMD_0603]  (value not drawn)
R55  SMD 0603 Resistor  [RESISTOR_SMD_0603]  (value not drawn)
R56  SMD 0603 Resistor  [RESISTOR_SMD_0603]  (value not drawn)
R57  SMD 0603 Resistor  [RESISTOR_SMD_0603]  (value not drawn)
U4  OPA348AIDBVR  [FP-DBV0005A-IPC_A]
U5  OPA348AIDBVR  [FP-DBV0005A-IPC_A]
U6  OPA348AIDBVR  [FP-DBV0005A-IPC_A]
U7  OPA348AIDBVR  [FP-DBV0005A-IPC_A]

### Ports
TEMP1 (out, see MAIN_SCHEMATIC[2C], STM32[2A]), TEMP2 (out, see MAIN_SCHEMATIC[2C], STM32[2A]), TEMP3 (out, see MAIN_SCHEMATIC[2C], STM32[2B]), TEMP4 (out, see MAIN_SCHEMATIC[2D], STM32[2B])

### Nets
3V3: C35.1 C37.1 C39.1 C41.1 R26.2 R27.1 R34.2 R35.1 R42.2 R43.1 R50.2 R51.1 U4.5(V+) U5.5(V+) U6.5(V+) U7.5(V+)
GND: C35.2 C36.2 C37.2 C38.2 C39.2 C40.2 C41.2 C42.2 J8.1 J9.1 J10.1 J11.1 R30.1 R33.1 R38.1 R41.1 R46.1 R49.1 R54.1 R57.1 U4.2(V-) U5.2(V-) U6.2(V-) U7.2(V-)
NetC36_1: C36.1 R29.2 ; port TEMP1
NetC38_1: C38.1 R37.2 ; port TEMP2
NetC40_1: C40.1 R45.2 ; port TEMP3
NetC42_1: C42.1 R53.2 ; port TEMP4
NetJ8_2: J8.2 R26.1 R28.1
NetJ9_2: J9.2 R34.1 R36.1
NetJ10_2: J10.2 R42.1 R44.1
NetJ11_2: J11.2 R50.1 R52.1
NetR27_2: R27.2 R30.2 R31.1
NetR28_2: R28.2 R33.2 U4.3(+IN)
NetR29_1: R29.1 R32.2 U4.1(OUT)
NetR31_2: R31.2 R32.1 U4.4(-IN)
NetR35_2: R35.2 R38.2 R39.1
NetR36_2: R36.2 R41.2 U5.3(+IN)
NetR37_1: R37.1 R40.2 U5.1(OUT)
NetR39_2: R39.2 R40.1 U5.4(-IN)
NetR43_2: R43.2 R46.2 R47.1
NetR44_2: R44.2 R49.2 U6.3(+IN)
NetR45_1: R45.1 R48.2 U6.1(OUT)
NetR47_2: R47.2 R48.1 U6.4(-IN)
NetR51_2: R51.2 R54.2 R55.1
NetR52_2: R52.2 R57.2 U7.3(+IN)
NetR53_1: R53.1 R56.2 U7.1(OUT)
NetR55_2: R55.2 R56.1 U7.4(-IN)

### Notes on the sheet
- (near C35) 100nF
- (near R26) 680R
- (near R27) 680R
- (near R28) 100k
- (near R29) 470R
- (near J8) PT1000
- (near R30) 680R
- (near R31) 100k
- (near R32) 330k
- (near C36) 3.3nF
- (near R33) 330k
- (near R34) 680R
- (near R35) 680R
- (near C37) 100nF
- (near R36) 100k
- (near R37) 470R
- (near J9) PT1000
- (near R38) 680R
- (near R39) 100k
- (near R41) 330k
- (near R40) 330k
- (near C38) 3.3nF
- (near R42) 680R
- (near R43) 680R
- (near C39) 100nF
- (near J10) PT1000
- (near R46) 680R
- (near R47) 100k
- (near R44) 100k
- (near R45) 470R
- (near R49) 330k
- (near R48) 330k
- (near C40) 3.3nF
- (near R50) 680R
- (near R51) 680R
- (near R52) 100k
- (near C41) 100nF
- (near J11) PT1000
- (near R54) 680R
- (near R55) 100k
- (near R53) 470R
- (near R57) 330k
- (near R56) 330k
- (near C42) 3.3nF
- (in symbol CMP-0272-00993-4) +; -
- (in symbol SMD 0603 Capacitor) 0603
- (in symbol SMD 0603 Resistor) 0603

### Library data of the parts
C35-C42 = SMD 0603 Capacitor: 0603 capacitor
J8-J11 = CMP-2000-05888-3: as J1 on sheet MAIN_SCHEMATIC; Packaging: Bulk; Contact Material: Brass; Lead Free: Lead Free; Orientation: Straight; Contact Plating: Tin; Max Current Rating: 3A; Termination: Solder; Fastening Type: Detent; Depth: 5.75mm; Housing Material: Polyamide; REACH SVHC: No SVHC; Series: XH; Voltage Rating (AC): 250V; Number of Positions: 2; Color: Natural; Contact Type: Male Pin; Max Voltage Rating (DC): 250V; Pitch: 2.5mm; Lead Pitch: 2.5mm; Mount: Through Hole; Max Operating Temperature: 85°C; Length: 7.4mm; Max Voltage Rating (AC): 250V; Min Operating Temperature: -25°C; Number of Rows: 1; Housing Color: White
R26-R57 = SMD 0603 Resistor: 0603 resistor
U4-U7 = CMP-0272-00993-4: IC OPAMP GP 1 CIRCUIT SOT23-5; Output Current per Channel: 10mA; Input Bias Current: 10pA; Number of Circuits: 1; Nominal Supply Current: 65uA; Voltage Gain: 108dB; Bandwidth: 1MHz; Max Supply Voltage: 5.5V; Input Offset Voltage (Vos): 5mV; Slew Rate: 0.5V/µs; Power Supply Rejection Ratio (PSRR): 84.44dB; Common Mode Rejection Ratio: 70dB; Operating Supply Current: 45uA; Min Supply Voltage: 2.5V; Number of Pins: 5; Length: 2.9mm; Min Operating Temperature: -40°C; Number of Channels: 1; Case/Package: SOT-23; Number of Elements: 1; Package Quantity: 3000; Max I/O Voltage: 5mV; Gain Bandwidth Product: 1MHz; Contact Plating: Gold; Number of Amplifiers: 1; Lead Free: Lead Free; REACH SVHC: No SVHC; Nominal Gain Bandwidth Product: 1MHz; Width: 1.6mm; Radiation Hardening: No; Height: 1.15mm; Packaging: Tape and Reel; Unity Gain Bandwidth Product: 1MHz; Max Operating Temperature: 125°C

## Sheet SR40A.SchDoc
size A4; SheetNumber: 6; SheetTotal: 9
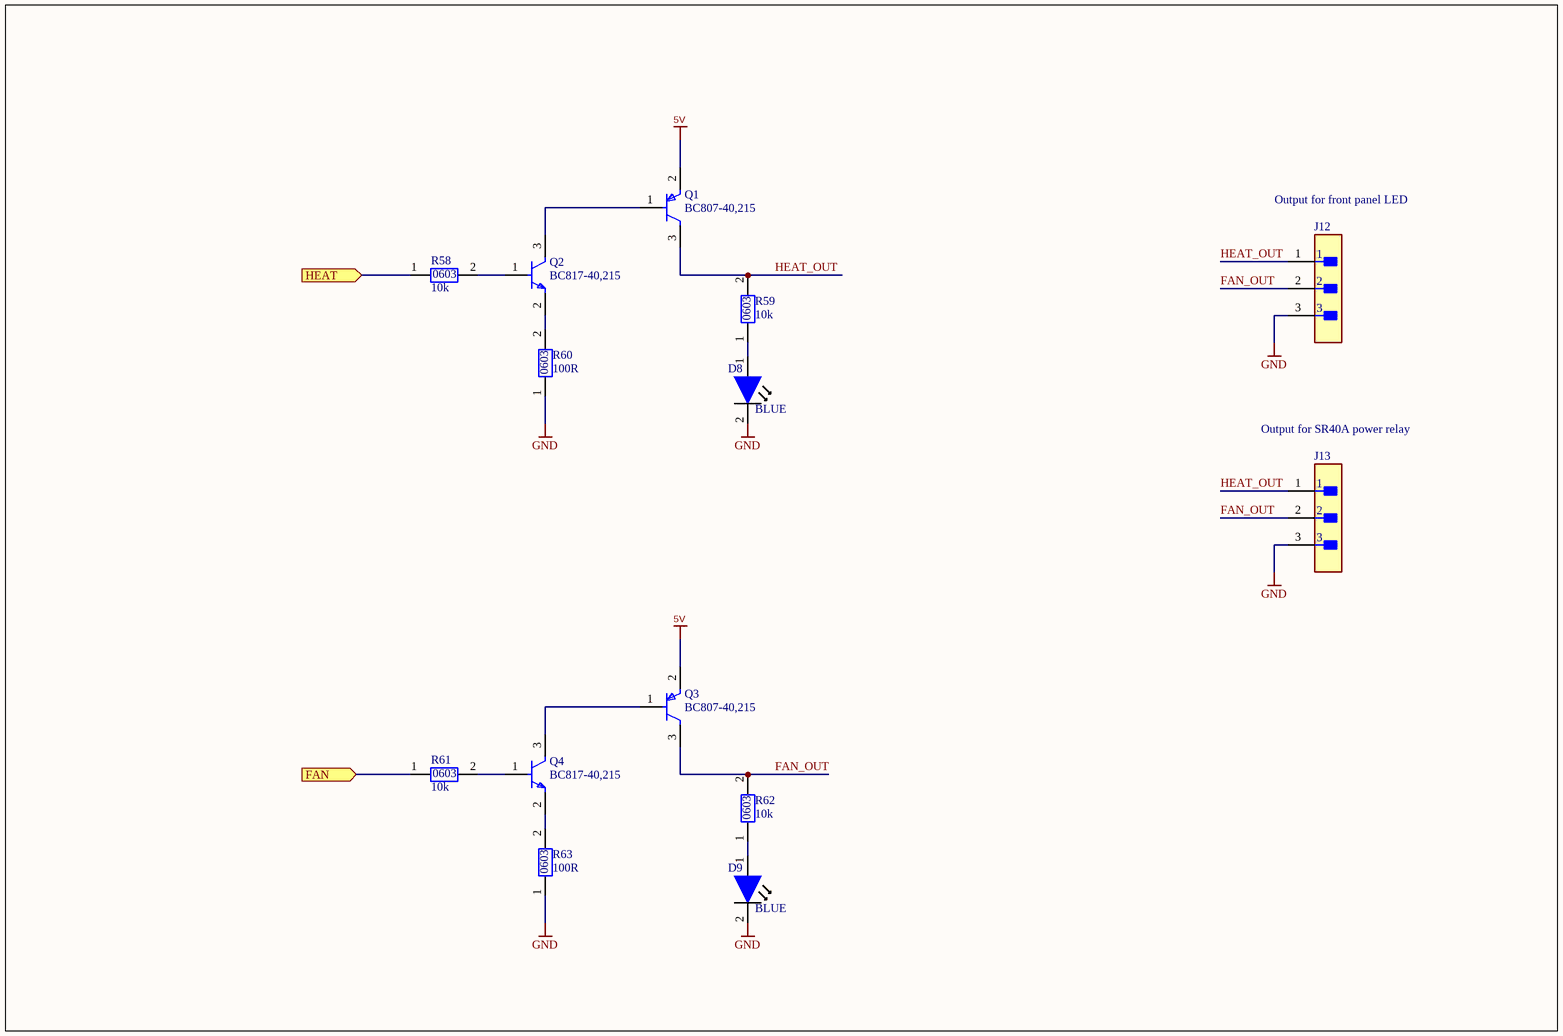
[diagram p5: SR40A.SchDoc]

### Parts
D8  SMD LED 0603  [0603 LED]  (value not drawn)
D9  SMD LED 0603  [0603 LED]  (value not drawn)
J12  B3B-XH-A(LF)(SN)  [FP-B3B-XH-A_LF_SN-MFG]  (value not drawn)
J13  B3B-XH-A(LF)(SN)  [FP-B3B-XH-A_LF_SN-MFG]  (value not drawn)
Q1  BC807-40,215  [FP-SOT23-IPC_B]
Q2  BC817-40,215  [FP-SOT23-MFG]
Q3  BC807-40,215  [FP-SOT23-IPC_B]
Q4  BC817-40,215  [FP-SOT23-MFG]
R58  SMD 0603 Resistor  [RESISTOR_SMD_0603]  (value not drawn)
R59  SMD 0603 Resistor  [RESISTOR_SMD_0603]  (value not drawn)
R60  SMD 0603 Resistor  [RESISTOR_SMD_0603]  (value not drawn)
R61  SMD 0603 Resistor  [RESISTOR_SMD_0603]  (value not drawn)
R62  SMD 0603 Resistor  [RESISTOR_SMD_0603]  (value not drawn)
R63  SMD 0603 Resistor  [RESISTOR_SMD_0603]  (value not drawn)

### Ports
FAN (in, see MAIN_SCHEMATIC[3C], STM32[2A]), HEAT (in, see MAIN_SCHEMATIC[3C], STM32[2A])

### Nets
5V: Q1.2(E) Q3.2(E)
GND: D8.2 D9.2 J12.3 J13.3 R60.1 R63.1
FAN_OUT: J12.2 J13.2 Q3.3(C) R62.2
HEAT_OUT: J12.1 J13.1 Q1.3(C) R59.2
NetD8_1: D8.1 R59.1
NetD9_1: D9.1 R62.1
NetQ1_1: Q1.1(B) Q2.3(C)
NetQ2_1: Q2.1(B) R58.2
NetQ2_2: Q2.2(E) R60.2
NetQ3_1: Q3.1(B) Q4.3(C)
NetQ4_1: Q4.1(B) R61.2
NetQ4_2: Q4.2(E) R63.2
NetR58_1: R58.1 ; port HEAT
NetR61_1: R61.1 ; port FAN

### Notes on the sheet
- Output for front panel LED
- (near R58) 10k
- (near R60) 100R
- (near R59) 10k
- (near D8) BLUE
- Output for SR40A power relay
- (near R61) 10k
- (near R62) 10k
- (near R63) 100R
- (near D9) BLUE
- (in symbol SMD 0603 Resistor) 0603

### Library data of the parts
D8 D9 = SMD LED 0603: 0603 LED
J12 J13 = CMP-17439-000014-3: CONN HEADER VERT 3POS 2.5MM; Max Voltage Rating (DC): 250V; Number of Positions: 3; Current Rating: 3A; Gender: Male; Wire/Cable Gauge: 22AWG; Contact Resistance: 20mR; Insulation Resistance: 1GR; Insulation Material: Nylon; Contact Plating: Tin; Depth: 5.75mm; Contact Type: Male Pin; Max Operating Temperature: 85°C; Insulation Color: Natural; Voltage Rating (AC): 250V; Color: Natural; Connector Type: Header; Orientation: Straight; Fastening Type: Detent; Housing Color: White; Min Operating Temperature: -25°C; Termination: Solder; Voltage Rating: 250V; Series: XH; Pitch: 2.5mm; Contact Shape: Square; Number of Rows: 1; Lead Free: Lead Free; Packaging: Bulk; Mount: Through Hole; Flammability Rating: UL94 V-0; Max Voltage Rating (AC): 250V; REACH SVHC: No SVHC; Housing Material: Polyamide; Contact Material: Brass; Lead Pitch: 2.5mm; Contact Finish - Mating: TIN; Length: 9.9mm; Max Current Rating: 3A; Number of Contacts: 3
Q1 Q3 = CMP-14406-000042-1: TRANS PNP 45V 500MA TO236AB; RoHS Compliant: Yes
Q2 Q4 = CMP-14406-000007-1: TRANS NPN 45V 0.5A SOT23; Manufacturer: Nexperia; Collector Emitter Saturation Voltage: 700mV; Power Dissipation: 250mW; Collector Base Voltage: 50V; Unity Gain Freq: 100MHz; Hfe Max: 600; Rthja Max: 500K/W; Emitter Base Voltage: 5V; Max Collector Current: 500mA; Hfe Testvce: 1V; Automotive Grade: Grade 0; Hfe Min: 250; Max Junction Temp: +150°C; Number Of Npn: 1; Hfe Testic: 100mA; Octopart: https://octopart.com/bc817-40%2C215-nexperia-78739081; Lead Free: Yes; Ipc Land Pattern Name: SOT95P230X100-3; Manufacturer Part Number: BC817-40,215; RoHS: TRUE; Collector Emitter Breakdown Voltage: 45V; Digikey Description: TRANS NPN 45V 0.5A SOT23; ComponentLink2URL: https://assets.nexperia.com/documents/data-sheet/BC817_SER.pdf; Temperature Range High: +150°C; Mouser Description: BC817 Series 45 V 500 mA 250 mW SMT NPN General-Purpose Transistor - SOT-23-; Device Class L3: BJTs; Temperature: to +150°C; Height: 1.1mm; Automotive: Yes; Ambient Temperature Range Low: -65°C; Package: SOT23; Collector Emitter Voltage: 45V; Category: Trans; ComponentLink2Description: Datasheet; Device Class L2: Transistors; Ambient Temperature Range High: +150°C; Number Of Elements: 1; Device Class L1: Discrete Semiconductors; Footprint Url: https://assets.nexperia.com/documents/outline-drawing/SOT23.pdf
R58-R63 = SMD 0603 Resistor: 0603 resistor

## Sheet SD_CARD.SchDoc
size A4; SheetNumber: 7; SheetTotal: 9
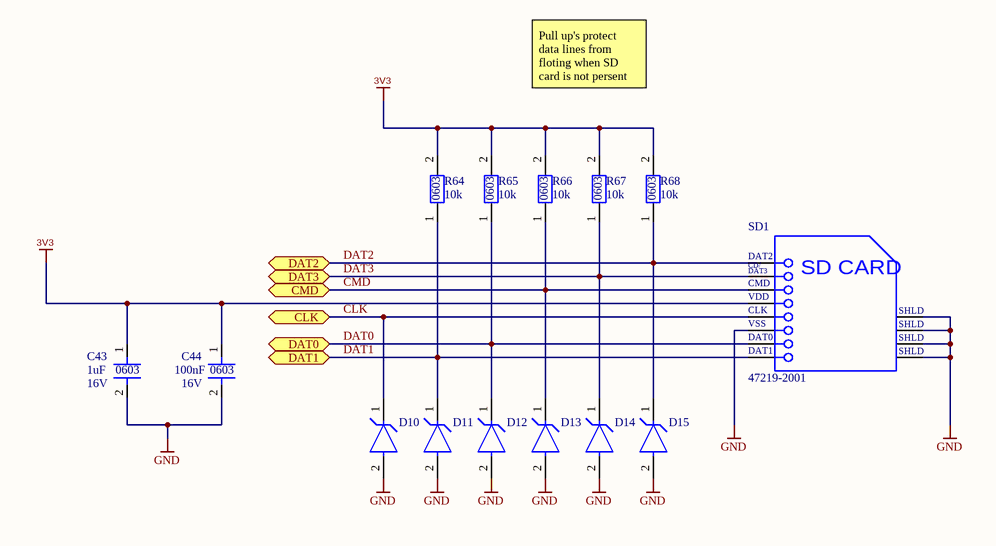
[diagram p6: SD_CARD.SchDoc]

### Parts
C43  SMD 0603 Capacitor  [CAPACITOR_SMD_0603]  (value not drawn)
C44  SMD 0603 Capacitor  [CAPACITOR_SMD_0603]  (value not drawn)
D10  ESD7351HT1G  [FP-477-02-MFG]  (value not drawn)
D11  ESD7351HT1G  [FP-477-02-MFG]  (value not drawn)
D12  ESD7351HT1G  [FP-477-02-MFG]  (value not drawn)
D13  ESD7351HT1G  [FP-477-02-MFG]  (value not drawn)
D14  ESD7351HT1G  [FP-477-02-MFG]  (value not drawn)
D15  ESD7351HT1G  [FP-477-02-MFG]  (value not drawn)
R64  SMD 0603 Resistor  [RESISTOR_SMD_0603]  (value not drawn)
R65  SMD 0603 Resistor  [RESISTOR_SMD_0603]  (value not drawn)
R66  SMD 0603 Resistor  [RESISTOR_SMD_0603]  (value not drawn)
R67  SMD 0603 Resistor  [RESISTOR_SMD_0603]  (value not drawn)
R68  SMD 0603 Resistor  [RESISTOR_SMD_0603]  (value not drawn)
SD1  47219-2001  [MOLX-47219-2001-8_V]

### Ports
CLK (bidir, see MAIN_SCHEMATIC[3C], STM32[2C]), CMD (bidir, see MAIN_SCHEMATIC[3C], STM32[3B]), DAT0 (bidir, see MAIN_SCHEMATIC[3C], STM32[2C]), DAT1 (bidir, see MAIN_SCHEMATIC[3C], STM32[2C]), DAT2 (bidir, see MAIN_SCHEMATIC[3C], STM32[2C]), DAT3 (bidir, see MAIN_SCHEMATIC[3C], STM32[2C])

### Nets
3V3: C43.1 C44.1 R64.2 R65.2 R66.2 R67.2 R68.2 SD1.4(VDD)
GND: C43.2 C44.2 D10.2(A) D11.2(A) D12.2(A) D13.2(A) D14.2(A) D15.2(A) SD1.6(VSS) SD1.9(SHLD) SD1.10(SHLD) SD1.11(SHLD) SD1.12(SHLD)
CLK: D10.1(C) SD1.5(CLK) ; port CLK
CMD: D13.1(C) R66.1 SD1.3(CMD) ; port CMD
DAT0: D12.1(C) R65.1 SD1.7(DAT0) ; port DAT0
DAT1: D11.1(C) R64.1 SD1.8(DAT1) ; port DAT1
DAT2: D15.1(C) R68.1 SD1.1(DAT2) ; port DAT2
DAT3: D14.1(C) R67.1 SD1.2(CD/DAT3) ; port DAT3

### Notes on the sheet
- Pull up's protect data lines from floting when SD card is not persent
- (near R64) 10k
- (near R65) 10k
- (near R66) 10k
- (near R67) 10k
- (near R68) 10k
- (near C43) 16V
- (near C43) 1uF
- (near C44) 100nF
- (near C44) 16V
- (in symbol CMP-2000-05245-1) CD/; DAT3; SD CARD
- (in symbol SMD 0603 Capacitor) 0603
- (in symbol SMD 0603 Resistor) 0603

### Library data of the parts
C43 C44 = SMD 0603 Capacitor: 0603 capacitor
D10-D15 = CMP-00278-47358424-1: ESD7351HT1G ESD7351 Series 5 V 0.6 pF Uni-Directional ESD Protection Diode - SOD-323; Manufacturer Lifecycle Status: ACTIVE; Clamping Voltage: 10V; Max Junction Temperature (Tj): 150°C; Reverse Standoff Voltage: 3.3V; Direction: Unidirectional; Breakdown Voltage: 5V; Peak Pulse Power: 150mW; Peak Pulse Current: 3A; Power Line Protection: No; Capacitance: 430fF; Number of Unidirectional Channels: 1; Schedule B: 8536300000; Height: 1mm; Case/Package: SOD; Lifecycle Status: Production; Packaging: Tape & Reel (TR); RoHS: Compliant; Min Operating Temperature: -55°C; Composition: Zener; Max Operating Temperature: 150°C; Mount: Surface Mount; Min Breakdown Voltage: 5V; Lead Free: Lead Free; NexarPartId: 47358424; Number of Channels: 1
R64-R68 = SMD 0603 Resistor: 0603 resistor
SD1 = CMP-2000-05245-1: MicroSD Card Connector, Hinge Type, -40 to 85 degC, 8-Pin SMD, RoHS, Tape and Reel; Manufacturer: Molex; Current Rating: 500mA; Number of Contacts: 8; Pitch: 1.09mm; Insertion - Extraction Style: Hinged; Voltage Rating: 100VDC; Product: CardConnectors; Contact Material: CopperAlloy; Series: 47219; Packaging: Reel; Brand: Molex; Product Category: MemoryCardConnectors; Housing Material: Thermoplastic; Mounting Style: SMD/SMT; Termination Style: SMD; Datasheet Version: Rev. F, 06/2009; Card Type: microSD; Manufacturer URL: http://www.molex.com/; RoHS: Details; Datasheet URL: http://www.molex.com/pdm_docs/sd/472192001_sd.pdf; Factory Pack Quantity: 2400

## Sheet BUZZER.SchDoc
size A4; SheetNumber: 8; SheetTotal: 9
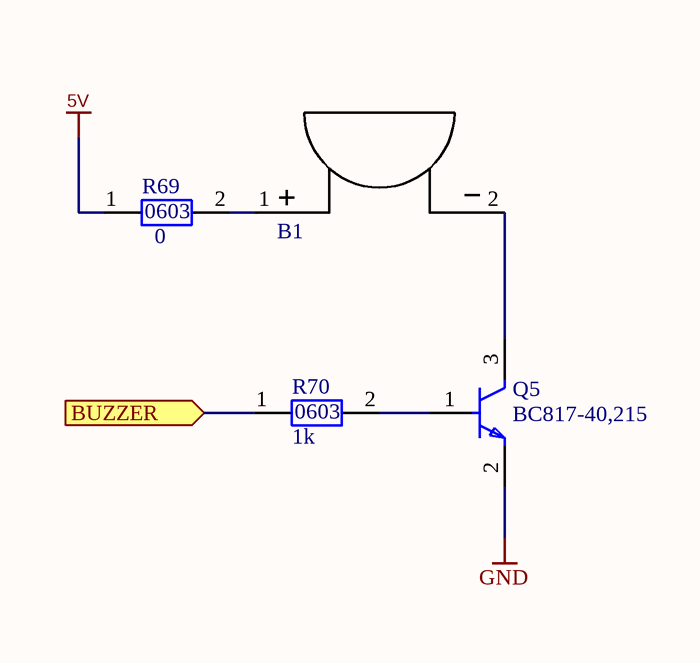
[diagram p7: BUZZER.SchDoc]

### Parts
B1  Buzzer  [Buzzer]  (value not drawn)
Q5  BC817-40,215  [FP-SOT23-MFG]
R69  SMD 0603 Resistor  [RESISTOR_SMD_0603]  (value not drawn)
R70  SMD 0603 Resistor  [RESISTOR_SMD_0603]  (value not drawn)

### Ports
BUZZER (in, see MAIN_SCHEMATIC[3C], STM32[2A])

### Nets
5V: R69.1
GND: Q5.2(E)
NetB1_1: B1.1 R69.2
NetB1_2: B1.2 Q5.3(C)
NetQ5_1: Q5.1(B) R70.2
NetR70_1: R70.1 ; port BUZZER

### Notes on the sheet
- (near R69) 0
- (near R70) 1k
- (in symbol SMD 0603 Resistor) 0603

### Library data of the parts
B1 = Buzzer: 5V buzzer
Q5 = CMP-14406-000007-1: as Q2 on sheet SR40A; Octopart: https://octopart.com/bc817-40%2C215-nexperia-78739081; Lead Free: Yes; Ipc Land Pattern Name: SOT95P230X100-3; Manufacturer Part Number: BC817-40,215; RoHS: TRUE; Collector Emitter Breakdown Voltage: 45V; Digikey Description: TRANS NPN 45V 0.5A SOT23; ComponentLink2URL: https://assets.nexperia.com/documents/data-sheet/BC817_SER.pdf; Temperature Range High: +150°C; Mouser Description: BC817 Series 45 V 500 mA 250 mW SMT NPN General-Purpose Transistor - SOT-23-; Device Class L3: BJTs; Temperature: to +150°C; Height: 1.1mm; Automotive: Yes; Ambient Temperature Range Low: -65°C; Package: SOT23; Collector Emitter Voltage: 45V; Category: Trans; ComponentLink2Description: Datasheet; Device Class L2: Transistors; Ambient Temperature Range High: +150°C; Number Of Elements: 1; Device Class L1: Discrete Semiconductors; Footprint Url: https://assets.nexperia.com/documents/outline-drawing/SOT23.pdf
R69 R70 = SMD 0603 Resistor: 0603 resistor

## Sheet 3V3_5V_LEVEL_SHIFTER.SchDoc
size A4; SheetNumber: 9; SheetTotal: 9
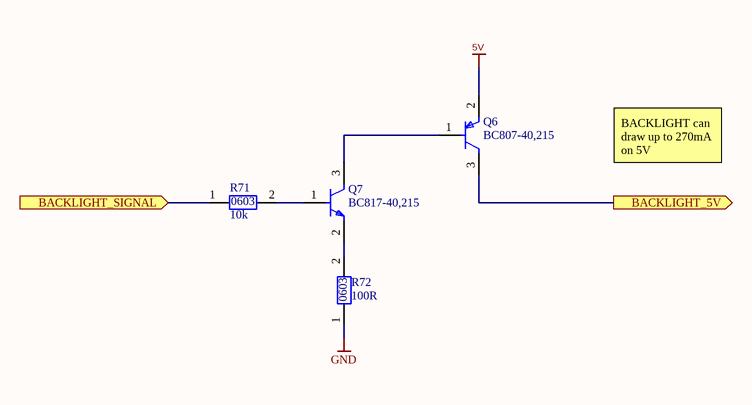
[diagram p8: 3V3_5V_LEVEL_SHIFTER.SchDoc]

### Parts
Q6  BC807-40,215  [FP-SOT23-IPC_B]
Q7  BC817-40,215  [FP-SOT23-MFG]
R71  SMD 0603 Resistor  [RESISTOR_SMD_0603]  (value not drawn)
R72  SMD 0603 Resistor  [RESISTOR_SMD_0603]  (value not drawn)

### Ports
BACKLIGHT_5V (out, see MAIN_SCHEMATIC[3A]), BACKLIGHT_SIGNAL (in, see MAIN_SCHEMATIC[2A], STM32[2B])

### Nets
5V: Q6.2(E)
GND: R72.1
BACKLIGHT_LCD: Q6.3(C) ; port BACKLIGHT_5V
BACKLIGHT_SIGNAL: R71.1 ; port BACKLIGHT_SIGNAL
NetQ6_1: Q6.1(B) Q7.3(C)
NetQ7_1: Q7.1(B) R71.2
NetQ7_2: Q7.2(E) R72.2

### Notes on the sheet
- (near R71) 10k
- BACKLIGHT can draw up to 270mA on 5V
- (near R72) 100R
- (in symbol SMD 0603 Resistor) 0603

### Library data of the parts
Q6 = CMP-14406-000042-1: TRANS PNP 45V 500MA TO236AB; RoHS Compliant: Yes
Q7 = CMP-14406-000007-1: as Q2 on sheet SR40A; Octopart: https://octopart.com/bc817-40%2C215-nexperia-78739081; Lead Free: Yes; Ipc Land Pattern Name: SOT95P230X100-3; Manufacturer Part Number: BC817-40,215; RoHS: TRUE; Collector Emitter Breakdown Voltage: 45V; Digikey Description: TRANS NPN 45V 0.5A SOT23; ComponentLink2URL: https://assets.nexperia.com/documents/data-sheet/BC817_SER.pdf; Temperature Range High: +150°C; Mouser Description: BC817 Series 45 V 500 mA 250 mW SMT NPN General-Purpose Transistor - SOT-23-; Device Class L3: BJTs; Temperature: to +150°C; Height: 1.1mm; Automotive: Yes; Ambient Temperature Range Low: -65°C; Package: SOT23; Collector Emitter Voltage: 45V; Category: Trans; ComponentLink2Description: Datasheet; Device Class L2: Transistors; Ambient Temperature Range High: +150°C; Number Of Elements: 1; Device Class L1: Discrete Semiconductors; Footprint Url: https://assets.nexperia.com/documents/outline-drawing/SOT23.pdf
R71 R72 = SMD 0603 Resistor: 0603 resistor

## Nets that join several sheets
3V3: MAIN_SCHEMATIC (J2.20 J4.6 J5.3), STM32 (19 pins), POWER_SUPPLY (7 pins), BUTTONS (J7.5), PT1000 (16 pins), SD_CARD (8 pins)
5V: MAIN_SCHEMATIC (J4.7 J5.4), POWER_SUPPLY (11 pins), SR40A (Q1.2 Q3.2), BUZZER (R69.1), 3V3_5V_LEVEL_SHIFTER (Q6.2)
GND: MAIN_SCHEMATIC (7 pins), STM32 (26 pins), POWER_SUPPLY (24 pins), BUTTONS (8 pins), PT1000 (24 pins), SR40A (6 pins), SD_CARD (13 pins), BUZZER (Q5.2), 3V3_5V_LEVEL_SHIFTER (R72.1)
VBat_IN: MAIN_SCHEMATIC (J3.1), STM32 (U3.1), POWER_SUPPLY (C14.1)
BACKLIGHT_LCD: MAIN_SCHEMATIC (J2.3 J2.4), 3V3_5V_LEVEL_SHIFTER (Q6.3)
BACKLIGHT_SIGNAL: STM32 (U3.50), 3V3_5V_LEVEL_SHIFTER (R71.1)
CLK: STM32 (U3.53), SD_CARD (D10.1 SD1.5)
CMD: STM32 (U3.54), SD_CARD (D13.1 R66.1 SD1.3)
DAT0: STM32 (U3.39), SD_CARD (D12.1 R65.1 SD1.7)
DAT1: STM32 (U3.40), SD_CARD (D11.1 R64.1 SD1.8)
DAT2: STM32 (U3.51), SD_CARD (D15.1 R68.1 SD1.1)
DAT3: STM32 (U3.52), SD_CARD (D14.1 R67.1 SD1.2)
I2C_SCL: MAIN_SCHEMATIC (J5.1), STM32 (R10.1 U3.58)
I2C_SDA: MAIN_SCHEMATIC (J5.2), STM32 (R11.1 U3.59)
LCD_INT: MAIN_SCHEMATIC (J2.14), STM32 (U3.37)
LCD_MISO: MAIN_SCHEMATIC (J2.17), STM32 (U3.35)
LCD_MOSI: MAIN_SCHEMATIC (J2.16), STM32 (U3.36)
LCD_RST: MAIN_SCHEMATIC (J2.13), STM32 (U3.38)
LCD_SCLK: MAIN_SCHEMATIC (J2.18), STM32 (U3.34)
LCD_SPI_CS: MAIN_SCHEMATIC (J2.15), STM32 (U3.33)
NetC31_1: STM32 (U3.26), BUTTONS (C31.1 R18.2)
NetC32_1: STM32 (U3.27), BUTTONS (C32.1 R20.2)
NetC33_1: STM32 (U3.28), BUTTONS (C33.1 R22.2)
NetC34_1: STM32 (U3.29), BUTTONS (C34.1 R24.2)
NetC36_1: STM32 (U3.20), PT1000 (C36.1 R29.2)
NetC38_1: STM32 (U3.21), PT1000 (C38.1 R37.2)
NetC40_1: STM32 (U3.22), PT1000 (C40.1 R45.2)
NetC42_1: STM32 (U3.23), PT1000 (C42.1 R53.2)
NetR58_1: STM32 (U3.15), SR40A (R58.1)
NetR61_1: STM32 (U3.14), SR40A (R61.1)
NetR70_1: STM32 (U3.16), BUZZER (R70.1)
USART_CK: MAIN_SCHEMATIC (J4.1), STM32 (U3.41)
USART_CTS: MAIN_SCHEMATIC (J4.4), STM32 (U3.44)
USART_RTS: MAIN_SCHEMATIC (J4.5), STM32 (U3.45)
USART_RX: MAIN_SCHEMATIC (J4.3), STM32 (U3.43)
USART_TX: MAIN_SCHEMATIC (J4.2), STM32 (U3.42)
Vin: MAIN_SCHEMATIC (J1.1), POWER_SUPPLY (D1.2)